# EAGLE design LUMI12_A (EAGLE 9.6.2)
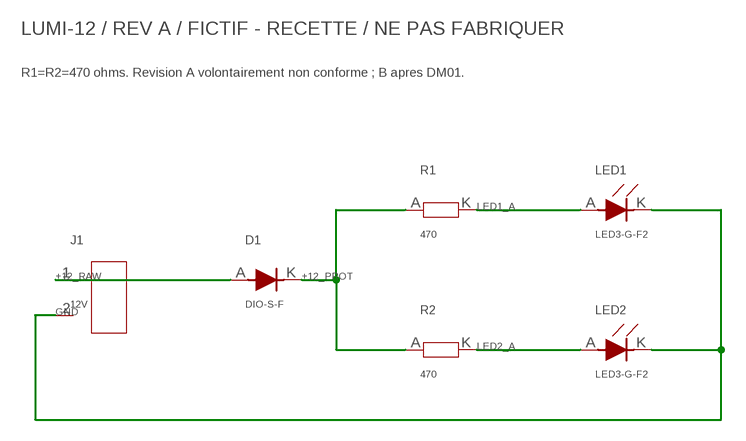
[diagram p0: schematic, sheet 1]

## Parts
D1  DIO-S-F  DIODE  [AXIAL]
J1  12V  CONN2  [BORNIER5]
LED1  LED3-G-F2  LED  [LED3]
LED2  LED3-G-F2  LED  [LED3]
R1  470  RES  [AXIAL]
R2  470  RES  [AXIAL]

## Nets
+12_PROT: D1.K R1.A R2.A
+12_RAW: D1.A J1.1
GND: J1.2 LED1.K LED2.K
LED1_A: LED1.A R1.K
LED2_A: LED2.A R2.K

## Notes on the sheet
- LUMI-12 / REV A / FICTIF - RECETTE / NE PAS FABRIQUER
- R1=R2=470 ohms. Revision A volontairement non conforme ; B apres DM01.

## Library data of the parts
D1 = LUMI12_FICTIF:DIODE
J1 = LUMI12_FICTIF:CONN2
LED1 LED2 = LUMI12_FICTIF:LED
R1 R2 = LUMI12_FICTIF:RES

## Net classes
0 default: width 0.254 mm, drill 0.8 mm

## Board
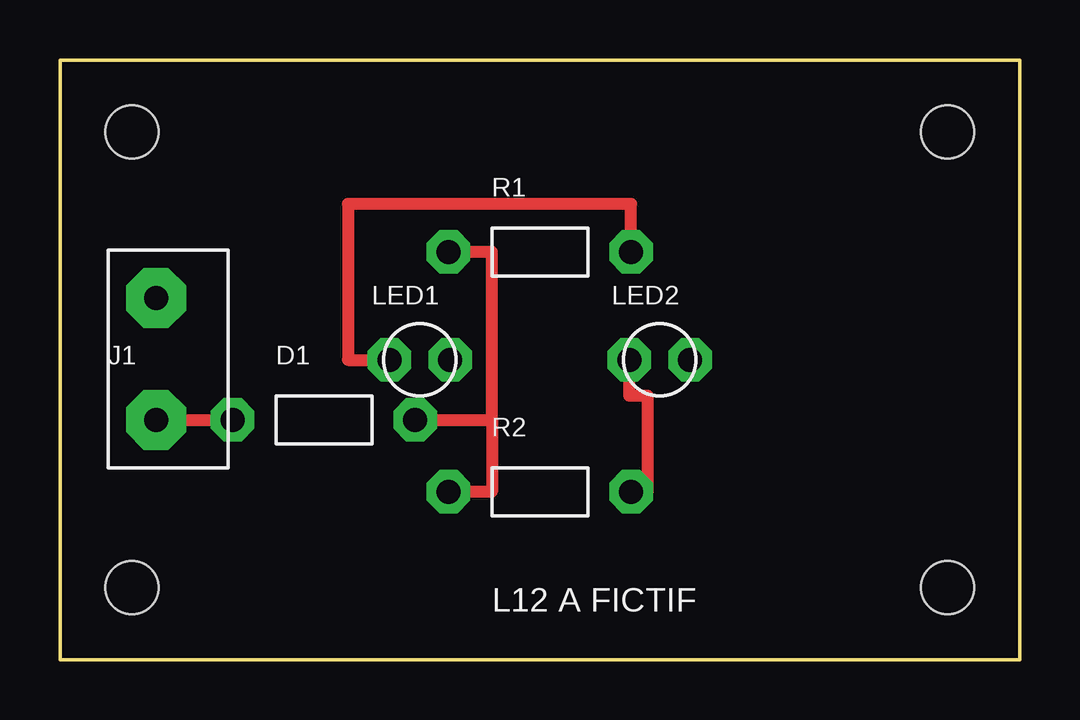
[diagram p1: board, top side]
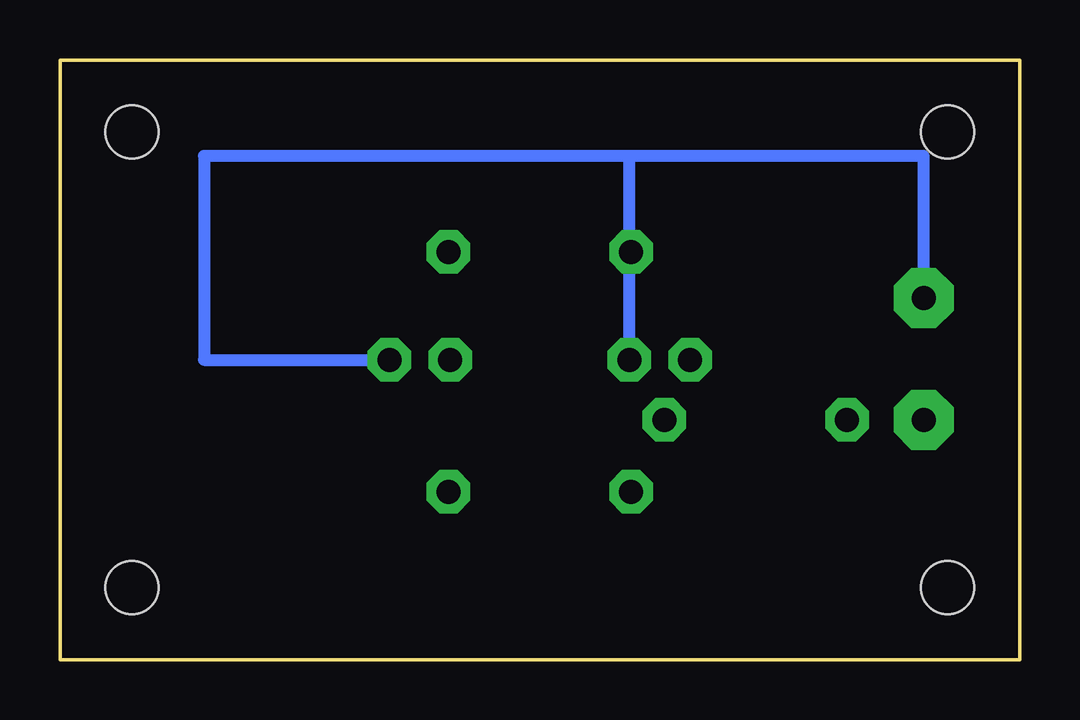
[diagram p2: board, bottom side, seen from below]

Size 40 x 25 mm. Coordinates in mm from the lower left corner, seen from the top.
Outline: 0,0 40,0 40,25 0,25 0,0
Copper layers (1*16): Top / Bottom
Design rules "RECETTE_NON_QUALIFIEE": minimum track width 10mil, minimum drill 0.8mm, track to track 8mil, track to pad 8mil, pad to pad 8mil
Holes 2.2 mm at 3,3 37,3 37,22 3,22

### Footprints (pad centres in the part's own frame; a part is rotated, then mirrored left to right if it is on the bottom)
AXIAL = drill 1 pad 1.8 octagon: A -3.81,0; K 3.81,0
BORNIER5 = drill 1 pad 2.5 octagon: 1 0,0; 2 0,5.08
LED3 = drill 1 pad 1.8 octagon: A -1.27,0; K 1.27,0

### Placement (x,y rotation side)
D1  11,10 0 top
J1  4,10 0 top
LED1  15,12.5 0 top
LED2  25,12.5 0 top
R1  20,17 0 top
R2  20,7 0 top

### Tracks (layer width: path | path; a pad name or v marks a point on that pad's centre or on a via)
+12_PROT
  Top 0.5: D1.K 18,10 | 18,10 18,17 R1.A | 18,10 18,7 R2.A
+12_RAW
  Top 0.5: J1.1 D1.A
GND
  Bottom 0.5: J1.2 4,21 16.27,21 | 16.27,21 34,21 34,12.5 LED2.K | LED1.K 16.27,21
LED1_A
  Top 0.5: R1.K 23.81,19 12,19 12,12.5 LED1.A
LED2_A
  Top 0.5: R2.K 24.5,7 24.5,11 23.73,11 LED2.A

### Text on the board
tPlace: L12 A FICTIF